# EasyEDA Pro project AED.epro

# Schematic 主控
Board Name: Board1; Create Date: 2025-11-03; Page Name: P1; Project Name: AED; Schematic Name: 主控; Update Date: 2025-11-26; Company: 嘉立创EDA; Page Size: A4; Version: V1.0
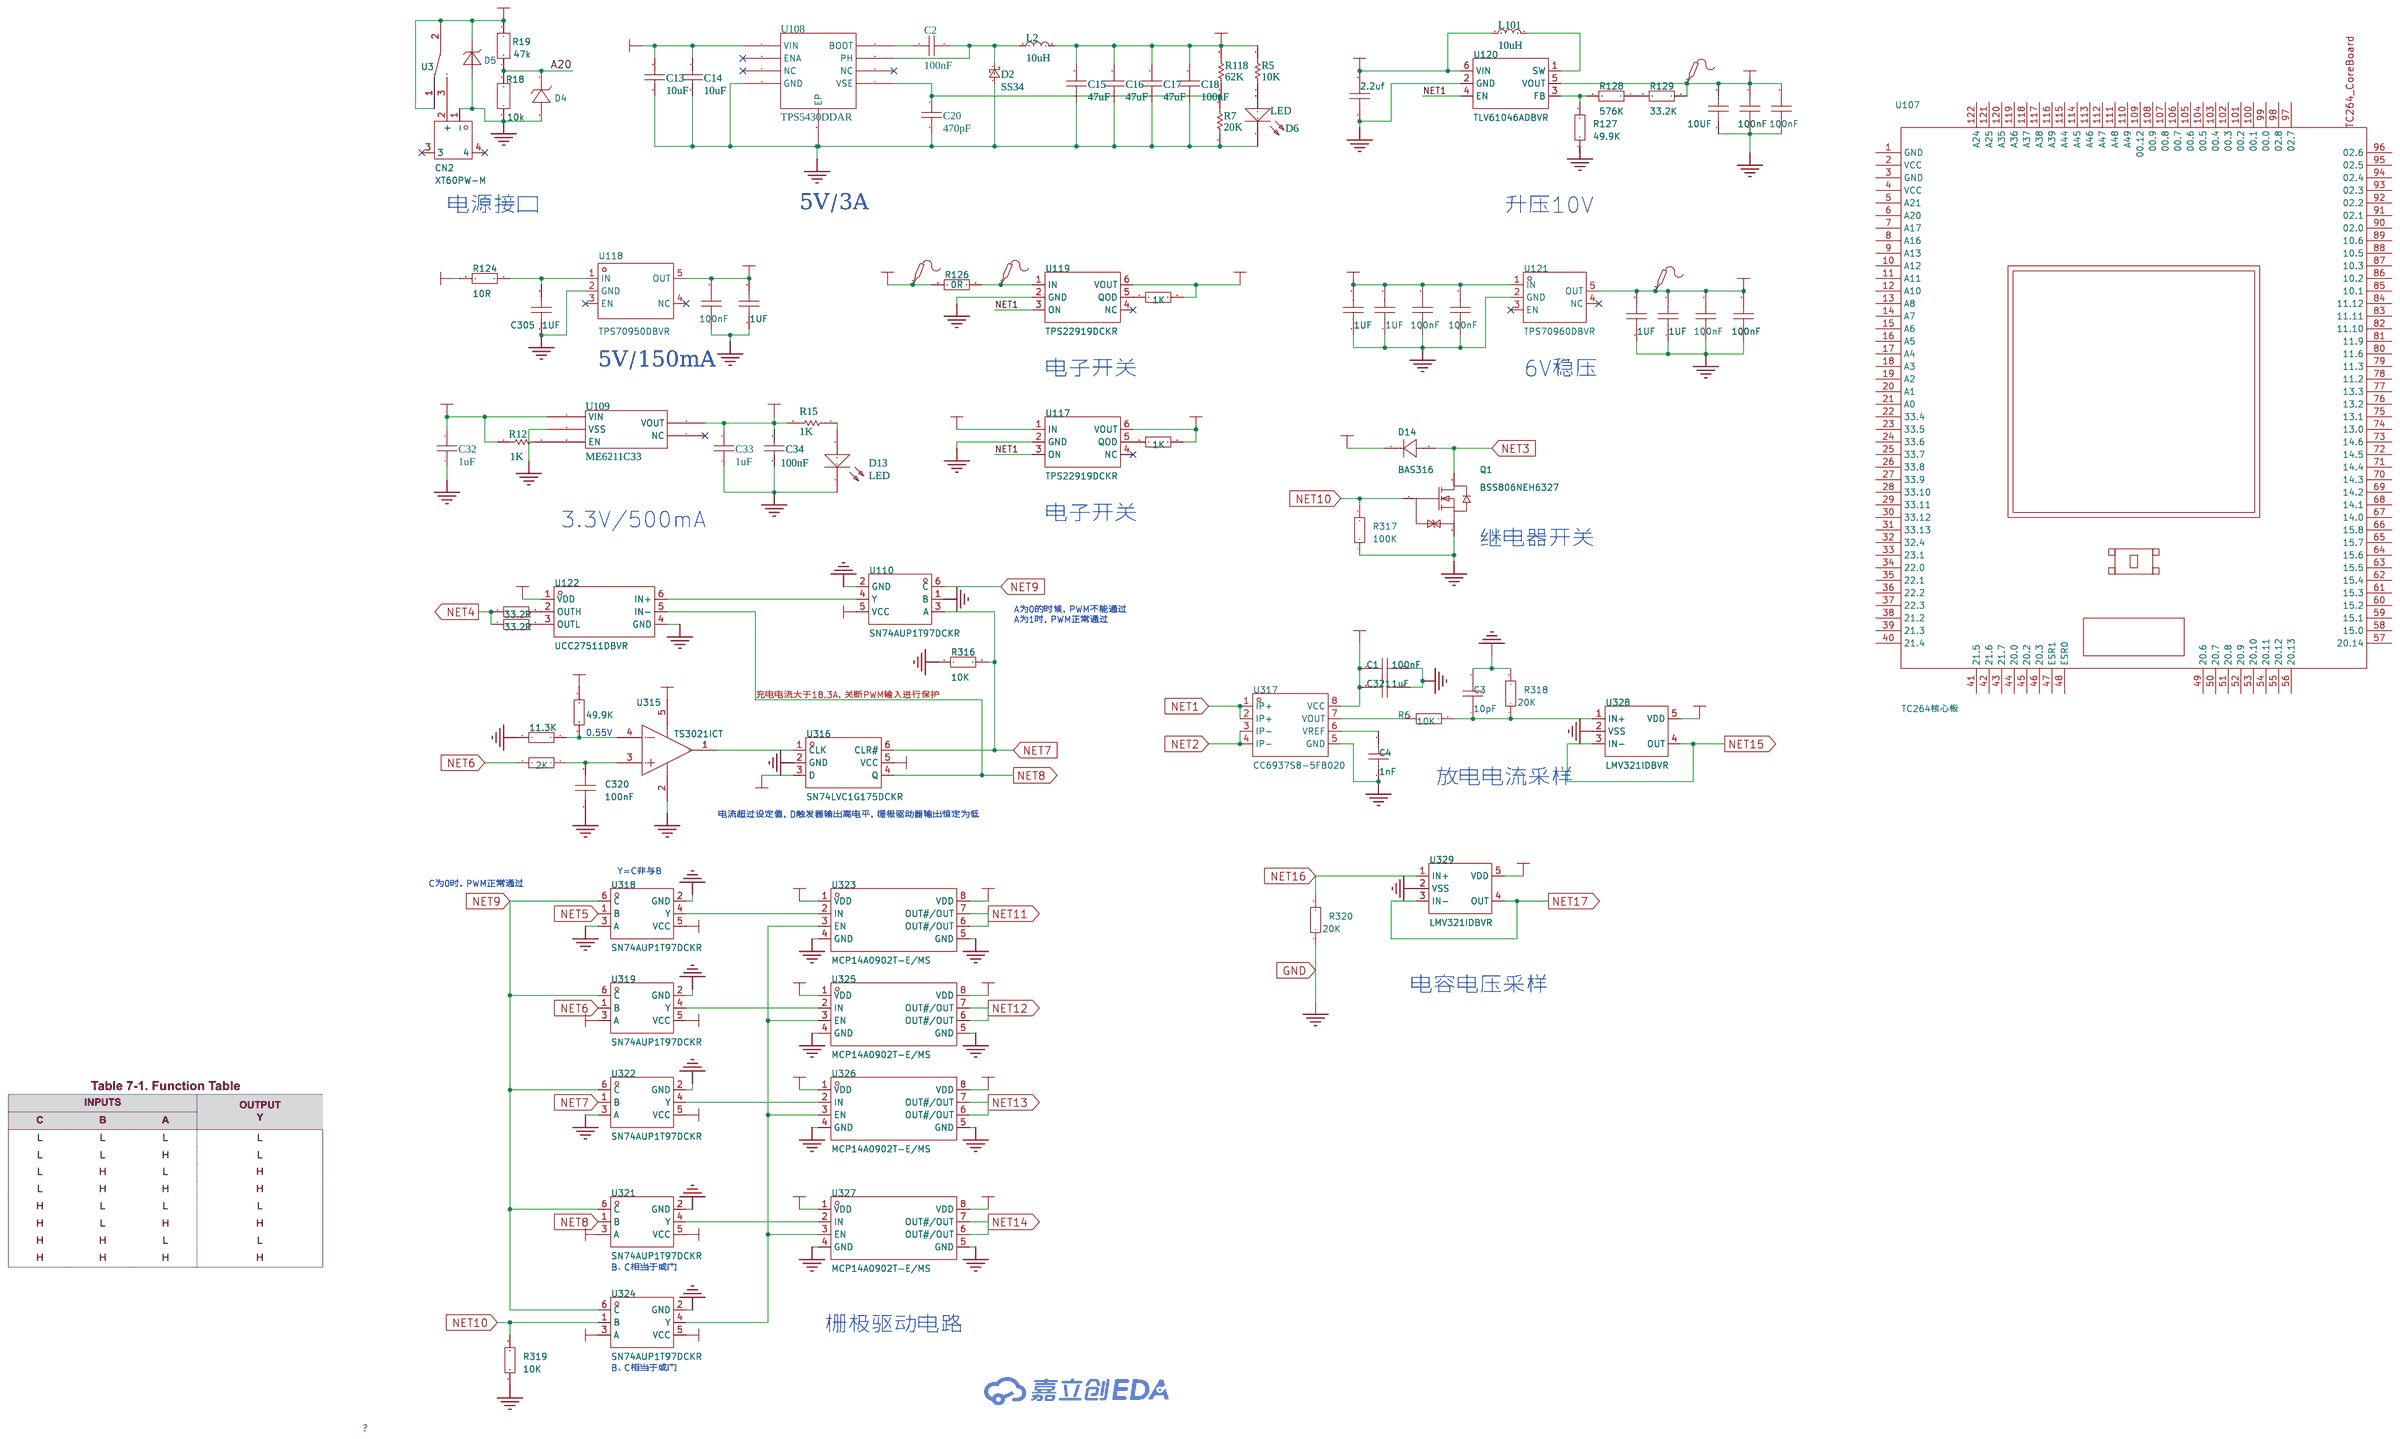
[diagram p0: schematic sheet]

## Parts
C1  100nF  [C0603]
C2  100nF  [0603_C]
C3  10pF  [C0603]
C4  1nF  [C0603]
C13  10uF  [1206_C]
C14  10uF  [1206_C]
C15  47uF  [1206_C]
C16  47uF  [1206_C]
C17  47uF  [1206_C]
C18  100nF  [0603_C]
C20  470pF  [0603_C]
C32  1uF  [0603_C]
C33  1uF  [0603_C]
C34  100nF  [0603_C]
C303  100nF  [C0603]
C305  1UF  [C0603]
C306  1UF  [C0603]
C307  2.2uf  [C0603]
C308  10UF  [C0603]
C309  100nF  [C0603]
C310  100nF  [C0603]
C311  1UF  [C0603]
C312  100nF  [C0603]
C313  1UF  [C0603]
C314  100nF  [C0603]
C315  1UF  [C0603]
C316  100nF  [C0603]
C317  1UF  [C0603]
C318  100nF  [C0603]
C320  100nF  [C0603]
C321  1uF  [C0603]
CN2  XT60PW-M  [CONN-TH_XT60PW-M]
D2  SS34  [SMA, DO-214AC]
D4  BZT52C3V3  [SOD-123_L2.7-W1.6-LS3.7-RD]
D5  SMAJ15A_C908769  [SMA_L4.3-W2.6-LS5.1-RD]
D6  LED  [0603_D]
D13  LED  [0603_D]
D14  BAS316  [SOD-323_L1.7-W1.3-LS2.6-RD-1]
L2  10uH  [SMD-2]
L101  10uH  [SMD-2]
Q1  BSS806NEH6327  [SOT-23_L2.9-W1.3-P1.90-LS2.4-BR]
R5  10K  [0603_R]
R6  10K  [R0603]
R7  20K  [0603_R]
R12  1K  [0603_R]
R15  1K  [0603_R]
R18  10k  [R0603]
R19  47k  [R0603]
R118  62K  [0603_R]
R122  1K  [R0603]
R124  10R  [R0603]
R125  1K  [R0603]
R126  0R  [R0603]
R127  49.9K  [R0603]
R128  576K  [R0603]
R129  33.2K  [R0603]
R310  33.2R  [R0603]
R311  33.2R  [R0603]
R313  49.9K  [R0603]
R314  11.3K  [R0603]
R315  2K  [R0603]
R316  10K  [R0603]
R317  100K  [R0603]
R318  20K  [R0603]
R319  10K  [R0603]
R320  20K  [R0603]
TP126  -  [Test-Point-0.5mm]
TP127  -  [Test-Point-0.5mm]
TP128  -  [Test-Point-0.5mm]
TP129  -  [Test-Point-0.5mm]
U3  MT-0-102-A101-M200-RS+PJ  [SW-TH_MT-0-103-A101-M200-RS]
U107  TC264核心板  [TC264逐飞]
U108  TPS5430DDAR  [SO-8]
U109  ME6211C33  [SOT-23-5]
U110  SN74AUP1T97DCKR  [SC-70-6_L2.0-W1.3-P0.65-LS2.2-BL]
U117  TPS22919DCKR  [SC-70-6_L2.2-W1.3-P0.65-LS2.1-BR]
U118  TPS70950DBVR  [SOT-23-5_L3.0-W1.7-P0.95-LS2.8-BR]
U119  TPS22919DCKR  [SC-70-6_L2.2-W1.3-P0.65-LS2.1-BR]
U120  TLV61046ADBVR  [SOT-23-6_L2.9-W1.6-P0.95-LS2.8-BL]
U121  TPS70960DBVR  [SOT-23-5_L2.9-W1.6-P0.95-LS2.8-BR]
U122  UCC27511DBVR  [SOT-23-6_L2.9-W1.6-P0.95-LS2.8-BL]
U315  TS3021ICT  [SC-70-5_L2.1-W1.3-P0.65-LS2.1-BL]
U316  SN74LVC1G175DCKR  [SC-70-6_L2.0-W1.3-P0.65-LS2.1-BR]
U317  CC6937S8-5FB020  [SOP-8_L4.9-W3.9-P1.27-LS6.0-BL]
U318  SN74AUP1T97DCKR  [SC-70-6_L2.0-W1.3-P0.65-LS2.2-BL]
U319  SN74AUP1T97DCKR  [SC-70-6_L2.0-W1.3-P0.65-LS2.2-BL]
U321  SN74AUP1T97DCKR  [SC-70-6_L2.0-W1.3-P0.65-LS2.2-BL]
U322  SN74AUP1T97DCKR  [SC-70-6_L2.0-W1.3-P0.65-LS2.2-BL]
U323  MCP14A0902T-E/MS  [MSOP-8_L3.0-W3.0-P0.65-LS4.9-BL]
U324  SN74AUP1T97DCKR  [SC-70-6_L2.0-W1.3-P0.65-LS2.2-BL]
U325  MCP14A0902T-E/MS  [MSOP-8_L3.0-W3.0-P0.65-LS4.9-BL]
U326  MCP14A0902T-E/MS  [MSOP-8_L3.0-W3.0-P0.65-LS4.9-BL]
U327  MCP14A0902T-E/MS  [MSOP-8_L3.0-W3.0-P0.65-LS4.9-BL]
U328  LMV321IDBVR  [SOT-23-5_L2.9-W1.6-P0.95-LS2.8-BR]
U329  LMV321IDBVR  [SOT-23-5_L2.9-W1.6-P0.95-LS2.8-BR]

## Library data of the parts
C1 C3 C4 C303 C305-C318 C320 C321 = CAP_0603: Supplier Footprint: 0603
C2 C18 = 100nF: 电容; Published: 8-Jun-2000; LatestRevisionDate: 29-May-2009; LatestRevisionNote: IPC-7351 Footprint Added.; PackageReference: C1206; Publisher: Altium Limited; PackageDescription: Chip Capacitor; Origin Footprint 2: 0805_C; Origin Footprint 3: 1206_C; Design Item ID: C; Library Name: MyLib; Check: false
C13 C14 = 10uF: 电容; Published: 8-Jun-2000; LatestRevisionDate: 29-May-2009; LatestRevisionNote: IPC-7351 Footprint Added.; PackageReference: C1206; Publisher: Altium Limited; PackageDescription: Chip Capacitor; Origin Footprint 2: 0603_C; Origin Footprint 3: 0805_C; Design Item ID: C; Library Name: MyLib; Check: false
C15-C17 = 47uF: 电容; Published: 8-Jun-2000; LatestRevisionDate: 29-May-2009; LatestRevisionNote: IPC-7351 Footprint Added.; PackageReference: C1206; Publisher: Altium Limited; PackageDescription: Chip Capacitor; Origin Footprint 2: 0603_C; Origin Footprint 3: 0805_C; Design Item ID: C; Library Name: MyLib; Check: false
C20 = 470pF: 电容; Published: 8-Jun-2000; LatestRevisionDate: 29-May-2009; LatestRevisionNote: IPC-7351 Footprint Added.; PackageReference: C1206; Publisher: Altium Limited; PackageDescription: Chip Capacitor; Origin Footprint 2: 0805_C; Origin Footprint 3: 1206_C; Design Item ID: C; Library Name: MyLib; Check: false
C32 C33 = 1uF: 电容; Published: 8-Jun-2000; LatestRevisionDate: 29-May-2009; LatestRevisionNote: IPC-7351 Footprint Added.; PackageReference: C1206; Publisher: Altium Limited; PackageDescription: Chip Capacitor; Origin Footprint 2: 0805_C; Origin Footprint 3: 1206_C; Design Item ID: C; Library Name: MyLib
C34 = 100nF: 电容; Published: 8-Jun-2000; LatestRevisionDate: 29-May-2009; LatestRevisionNote: IPC-7351 Footprint Added.; PackageReference: C1206; Publisher: Altium Limited; PackageDescription: Chip Capacitor; Origin Footprint 2: 0805_C; Origin Footprint 3: 1206_C; Design Item ID: C; Library Name: MyLib
CN2 = XT60PW-M: 类别:-;类型1:-;; LCSC Part Name: AMASS(艾迈斯)航模插头xt60连接器150公母对接pw锂电池公头 板插卧式XT60PW-M; Supplier Part: C98732; Manufacturer: AMASS(艾迈斯); JLCPCB Part Class: 扩展库; Datasheet: https://item.szlcsc.com/datasheet/XT60PW-M/99942.html; Supplier: LCSC; Type: 卧式插头; Colour: 黄色; InterfaceType: 公头
D2 = SS34: 二极管; Library Name: MyLib; Check: false
D4 = BZT52C3V3: Supplier: LCSC; Supplier Part: C908185; Manufacturer: FUXINSEMI(富芯森美); JLCPCB Part Class: Extended Part
D5 = SMAJ15A_C908769: Supplier: LCSC; Supplier Part: C908769; Manufacturer: GOODWORK(固得沃克); Manufacturer Part: SMAJ15A; JLCPCB Part Class: Extended Part
D6 = LED: 发光二极管; Published: 8-Jun-2000; LatestRevisionDate: 08-Jul-2005; LatestRevisionNote: Mech Layer 1 removed.; PackageReference: LED-0; Publisher: Altium Limited; PackageDescription: LED; 2 Leads; Library Name: MyLib; Check: false
D13 = LED: 发光二极管; Published: 8-Jun-2000; LatestRevisionDate: 08-Jul-2005; LatestRevisionNote: Mech Layer 1 removed.; PackageReference: LED-0; Publisher: Altium Limited; PackageDescription: LED; 2 Leads; Library Name: MyLib
D14 = BAS316_C7502720: 二极管配置:独立式;正向压降(Vf):1.25V@150mA;直流反向耐压(Vr):100V;整流电流:250mA;反向恢复时间(Trr):4ns;; Supplier Part: C7502720; Manufacturer: R+O(宏嘉诚); Supplier Footprint: SOD-323; JLCPCB Part Class: 扩展库; Datasheet: https://item.szlcsc.com/datasheet/BAS316/8589437.html; Supplier: LCSC; Diode Configuration: 独立式; Voltage - Forward(Vf@If): 1.25V@150mA; Voltage - DC Reverse(Vr): 100V; Current - Rectified: 250mA; Pd - Power Dissipation: 250mW; Reverse Leakage Current (Ir): 1uA; Reverse Recovery Time (trr): 4ns; Operating Junction Temperature Range: -55℃~+150℃; Non-Repetitive Peak Forward Surge Current: 2A
L2 L101 = 10uH: 电感; Origin Footprint 2: 0603_L; Design Item ID: L; Library Name: MyLib; Check: false
Q1 = BSS806NEH6327: 数量:1个N沟道;漏源电压(Vdss):20V;连续漏极电流(Id):2.3A;导通电阻(RDS(on)):57mΩ@2.5V,2.3A;耗散功率(Pd):500mW;阈值电压(Vgs(th)):750mV;; LCSC Part Name: 1个N沟道 耐压:20V 电流:2.3A; Supplier Part: C91714; Manufacturer: Infineon(英飞凌); Supplier Footprint: SOT-23; JLCPCB Part Class: 扩展库; Datasheet: https://item.szlcsc.com/datasheet/BSS806NEH6327/92903.html; Supplier: LCSC; Number: 1个N沟道; Drain to Source Voltage: 20V; Current - Continuous Drain(Id): 2.3A; RDS(on): 57mΩ@2.5V,2.3A; Pd - Power Dissipation: 500mW; Gate Threshold Voltage (Vgs(th)): 750mV; Gate Charge(Qg): 1.7nC@2.5V; Input Capacitance(Ciss): 529pF@10V; Reverse Transfer Capacitance (Crss@Vds): 29pF@10V; Operating Temperature: -55℃~+150℃
R5 R7 = 10K: 电阻; Published: 8-Jun-2000; LatestRevisionDate: 17-Jul-2002; LatestRevisionNote: Re-released for DXP Platform.; PackageReference: AXIAL-0.5; Publisher: Altium Limited; PackageDescription: Axial Device, Thru-Hole; 2 Leads; 0.5 in Pin Spacing; Design Item ID: R; Library Name: MyLib; Check: false
R6 R122 R124-R129 R310 R311 R313-R320 = Res_0603: Supplier Footprint: 0603
R12 = 1K: 电阻; Published: 8-Jun-2000; LatestRevisionDate: 17-Jul-2002; LatestRevisionNote: Re-released for DXP Platform.; PackageReference: AXIAL-0.5; Publisher: Altium Limited; PackageDescription: Axial Device, Thru-Hole; 2 Leads; 0.5 in Pin Spacing; Design Item ID: R; Library Name: MyLib
R15 = 10K: 电阻; Published: 8-Jun-2000; LatestRevisionDate: 17-Jul-2002; LatestRevisionNote: Re-released for DXP Platform.; PackageReference: AXIAL-0.5; Publisher: Altium Limited; PackageDescription: Axial Device, Thru-Hole; 2 Leads; 0.5 in Pin Spacing; Design Item ID: R; Library Name: MyLib
R18 = 10k
R19 = 47k
R118 = 51K: 电阻; Published: 8-Jun-2000; LatestRevisionDate: 17-Jul-2002; LatestRevisionNote: Re-released for DXP Platform.; PackageReference: AXIAL-0.5; Publisher: Altium Limited; PackageDescription: Axial Device, Thru-Hole; 2 Leads; 0.5 in Pin Spacing; Design Item ID: R; Library Name: MyLib; Check: false
TP126-TP129 = Test-Point: Test Point 测试点
U3 = MT-0-102-A101-M200-RS+PJ: Supplier: LCSC; Supplier Part: C1788492; Manufacturer: YUEN FUNG(源丰); JLCPCB Part Class: Extended Part; link: https://atta.szlcsc.com/upload/public/pdf/source/20201225/C1788492_A57BE75F5111615E295075D92E39ECB7.pdf
U107 = TC264核心板: Supplier: 逐飞
U108 = TPS5430DDAR: 降压芯片; Library Name: MyLib; Check: false
U109 = ME6211C33: 稳压芯片; Library Name: MyLib
U110 U318 U319 U321 U322 U324 = SN74AUP1T97DCKR: 数据速率:-;工作电压(VCCA):1.8V~2.7V;工作电压(VCCB):2.3V~3.6V;通道数:1;每个电路通道数:1;; LCSC Part Name: 1位单向电平转换器; Supplier Part: C2677402; Manufacturer: TI(德州仪器); Supplier Footprint: SC-70-6; JLCPCB Part Class: 扩展库; Datasheet: https://www.ti.com/cn/lit/gpn/sn74aup1t97; Supplier: LCSC; Channel Type: 单向; Voltage - Supply(VCCA): 1.8V~2.7V; Voltage - Supply(VCCB): 2.3V~3.6V; Number of Circuits: 1; Output Type: 单端; Operating Temperature: -40℃~+85℃; Features: 可配置门逻辑功能
U117 U119 = TPS22919DCKR: 类型:负载开关;通道数:1;输入控制逻辑:高电平有效;最大连续电流:1.5A;工作电压:1.6V~5.5V;导通电阻:89mΩ;; LCSC Part Name: 5.5V 1.5A 90mΩ 受控上升时间自保护负载开关; Supplier Part: C2149796; Manufacturer: TI(德州仪器); Supplier Footprint: SC-70-6; JLCPCB Part Class: 扩展库; Datasheet: https://www.ti.com/cn/lit/gpn/tps22919; Supplier: LCSC; Type: 负载开关; Number of Channels: 1; Control Input Logic: 高电平有效; Maximum Continuous Current: 1.5A; Voltage - Supply: 1.6V~5.5V; RDS(on): 89mΩ; Operating Temperature	-: -40℃~+125℃; Features: 过热保护(OTP)；短路保护(SCP)
U118 = TPS70950DBVR: 输出类型:固定;最大输入电压:30V;输出电压:5V;输出电流:150mA;电源纹波抑制比(PSRR):80dB;输出极性:正极;; LCSC Part Name: 具有反向电流保护和使能功能的 150mA、30V、超低 IQ、低压降稳压器; Supplier Part: C96028; Manufacturer: TI(德州仪器); Supplier Footprint: SOT-23-5; JLCPCB Part Class: 扩展库; Datasheet: https://www.ti.com/cn/lit/gpn/tps709; Supplier: LCSC; Output Type: 固定; Maximum Input Voltage: 30V; Output Voltage: 5V; Output Current: 150mA; Power Supply Rejection Ratio (PSRR): 80dB; Dropout Voltage: 1.2V@(150mA); standby current: 2.05uA; Feature: 防静电保护；低ESR；热保护(TSD)；欠压闭锁；过流保护(OCP)；带使能；防倒灌; Operating Temperature: -40℃~+125℃; Output Polarity: 正极; Number of Outputs: 1
U120 = TLV61046ADBVR: 功能类型:升压型;输出类型:可调;输入电压:1.8V~5.5V;输出电压:3.3V~28V;输出电流(最大值):-;; Supplier Part: C464815; Manufacturer: TI(德州仪器); Supplier Footprint: SOT-23-6; JLCPCB Part Class: 扩展库; Datasheet: https://www.ti.com/cn/lit/gpn/tlv61046a; Supplier: LCSC; Function: 升压型; Output Type: 可调; Input Voltage: 1.8V~5.5V; Output Voltage: 3.3V~28V; Switching Frequency: 1.05MHz; Operating Temperature: -40℃~+125℃@(TJ); Number of Outputs: 1; Topology: 升压式; Switch tube (built-in/external): 内置
U121 = TPS70960DBVR: 输出类型:固定;最大输入电压:30V;输出电压:6V;输出电流:150mA;输出极性:正极;; LCSC Part Name: 具有反向电流保护和使能功能的 150mA、30V、超低 IQ、低压降稳压器; Supplier Part: C2760467; Manufacturer: TI(德州仪器); Supplier Footprint: SOT-23-5; JLCPCB Part Class: 扩展库; Datasheet: https://www.ti.com/cn/lit/gpn/tps709; Supplier: LCSC; Output Type: 固定; Maximum Input Voltage: 30V; Output Voltage: 6V; Output Current: 150mA; Dropout Voltage: 1.2V@(150mA); standby current: 2.05uA; Feature: 防静电保护；热保护(TSD)；欠压闭锁；过流保护(OCP)；带使能；防倒灌; Operating Temperature: -40℃~+125℃; Output Polarity: 正极; Number of Outputs: 1
U122 = UCC27511DBVR: 驱动配置:低边;负载类型:IGBT；MOSFET;驱动通道数:1;灌电流(IOL):8A;拉电流(IOH):4A;工作电压:4.5V~18V;上升时间(tr):8ns;下降时间(tf):7ns;; LCSC Part Name: 单通道、高速、低端栅极驱动器; Supplier Part: C191027; Manufacturer: TI(德州仪器); Supplier Footprint: SOT-23-6; JLCPCB Part Class: 扩展库; Datasheet: https://www.ti.com/cn/lit/gpn/ucc27511; Supplier: LCSC; Driven Configuration: 低边; Load Type: IGBT；MOSFET; Number of Drivers: 1; Current - Output Low(IOL): 8A; Current - Output High(IOH): 4A; Voltage - Supply: 4.5V~18V; Rise Time: 8ns; Fall Time: 7ns; Propagation Delay tpLH: 13ns; Propagation Delay tpHL: 13ns; Features: 欠压保护(UVP); Operating Temperature: -40℃~+140℃; Input Logic Level - High: 2.2V~2.4V; Input Logic Level - Low: 1V~1.2V; Quiescent Current(Iq): 100uA
U315 = TS3021ICT: 输入失调电压(Vos):6mV;输入偏置电流(Ib):160nA;; Supplier Part: C443981; Manufacturer: ST(意法半导体); Supplier Footprint: SC-70; JLCPCB Part Class: 扩展库; Datasheet: https://atta.szlcsc.com/upload/public/pdf/source/20191104/C443981_776DA475306693A7E4F23C19D704A3F3.pdf; Supplier: LCSC; Input Offset Voltage (Vos): 6mV; Input Bias Current (Ib): 160nA; Common Mode Rejection Ratio (CMRR): 79dB; Supply Voltage: 1.8V~5V; Output Type: 推挽; Operating Temperature: -40℃~+125℃
U316 = SN74LVC1G175DCKR: 类型:D-型;工作电压:1.65V~5.5V;时钟频率(fc):175MHz;元件数:1;每个元件位数:1;传播延迟(tpd):5ns@5V,50pF;静态电流(Iq):10uA;; LCSC Part Name: 单路D型触发器与异步清除; Supplier Part: C202238; Manufacturer: TI(德州仪器); Supplier Footprint: SOT-363-6; JLCPCB Part Class: 扩展库; Datasheet: https://www.ti.com/cn/lit/gpn/sn74lvc1g175; Supplier: LCSC; Type: D-型; Trigger Type: 上升沿; Voltage - Supply: 1.65V~5.5V; Clock Frequency: 175MHz; Function: 复位; Number of Elements: 1; Number of Bits per Element: 1; Propagation Delay: 5ns@5V,50pF; Series: 74LVC系列; Current - Output Low(IOL): 32mA; Current - Output High(IOH): 32mA; Quiescent Current: 10uA; Input Capacitance: 3pF; Operating Temperature: -40℃~+125℃
U317 = CC6937S8-5FB020: Supplier Part: C41421925; Manufacturer: CrossChip(成都芯进); Supplier Footprint: SOP-8; JLCPCB Part Class: 扩展库; Datasheet: https://atta.szlcsc.com/upload/public/pdf/source/20241008/FBE923A19560CB1EFA280EA7B85C6E96.pdf; Supplier: LCSC
U323 U325-U327 = MCP14A0902T-E/MS: 驱动配置:低边；高边;负载类型:MOSFET;驱动通道数:2;峰值灌电流:9A;峰值拉电流:9A;电源电压:4.5V~18V;上升时间:22ns;下降时间:22ns;; Supplier Part: C627011; Manufacturer: MICROCHIP(美国微芯); Supplier Footprint: MSOP-8; JLCPCB Part Class: 扩展库; Datasheet: https://atta.szlcsc.com/upload/public/pdf/source/20221017/A342458C727318430080595DBBFFEC04.pdf; Supplier: LCSC; Driven Configuration: 低边；高边; Load Type: MOSFET; Number of Drivers: 2; Peak Output Current(sink): 9A; Peak Output Current(source): 9A; Supply Voltage: 4.5V~18V; Rise Time: 22ns; Fall Time: 22ns; Operating Temperature: -40℃~+125℃@(Ta)
U328 U329 = LMV321IDBVR_C3014306: 放大器数:单路;轨到轨:轨到轨输入,轨到轨输出;增益带宽积(GBP):1MHz;输入失调电压(Vos):5mV;压摆率(SR):520V/ms;输入偏置电流(Ib):10pA;; LCSC Part Name: 低功耗，轨到轨运算放大器; Supplier Part: C3014306; Manufacturer: UMW(友台半导体); Supplier Footprint: SOT-23-5; JLCPCB Part Class: 扩展库; Datasheet: https://item.szlcsc.com/datasheet/LMV321IDBVR/3524159.html; Supplier: LCSC; Number of Channels: 单路; Maximum Power Supply Range (Vdd-Vss): 7.5V; Rail to Rail: 轨到轨输入,轨到轨输出; Gain Bandwidth Product: 1MHz; Vos - Input Offset Voltage: 5mV; Input Offset Voltage Drift(Vos TC): 2.7uV/℃; Slew Rate: 520V/ms; Ib - Input Bias Current: 10pA; Input Offset Current(Ios): 10pA; Noise density(eN): 20nV/√Hz@10KHz; Common Mode Rejection Ratio(CMRR): 70dB; Quiescent Current: 45uA; Output Current: 25mA; Operating Temperature: -40℃~+125℃; Single supply: 2.1V~5.5V

## Nets
GND: C1.2 C3.2 C4.1 C13.1 C14.1 C15.1 C16.1 C17.1 C18.1 C20.1 C32.1 C33.1 C34.1 C303.1 C305.1 C306.1 C307.1 C308.1 C309.1 C310.1 C311.1 C312.1 C313.1 C314.1 C315.1 C316.1 C317.1 C318.1 C320.1 C321.2 CN2.1(-) D2.2(14) D4.2(A) D5.2 D6.1 D13.1 Q1.2(S) R7.1 R18.1 R127.1 R314.2 R316.1 R317.1 R318.2 R319.1 R320.1 U108.6(GND) U108.9(EP) U109.2(VSS) U110.1(B) U110.2(GND) U117.2(GND) U118.2(GND) U119.2(GND) U120.2(GND) U121.2(GND) U122.4(GND) U315.2(VCC-) U316.2(GND) U317.5(GND) U318.2(GND) U318.3(A) U319.2(GND) U321.2(GND) U322.2(GND) U322.3(A) U323.4(GND) U323.5(GND) U324.2(GND) U325.4(GND) U325.5(GND) U326.4(GND) U326.5(GND) U327.4(GND) U327.5(GND) U328.2(VSS) U329.2(VSS)
VBAT: C13.2 C14.2 D5.1 R19.2 R124.1 U3.1 U3.2 U108.7(VIN)
VCC_3V3: C33.2 C34.2 R15.2 U109.5(VOUT) U117.1(IN)
VCC_3V3_1: R122.2 R313.2 U110.5(VCC) U117.6(VOUT) U315.5(VCC+) U316.3(D) U316.5(VCC) U318.5(VCC) U319.3(A) U319.5(VCC) U321.3(A) U321.5(VCC) U322.5(VCC) U324.3(A) U324.5(VCC) U328.5(VDD) U329.5(VDD)
VCC_5V: C15.2 C16.2 C17.2 C18.2 C32.2 C307.2 L2.2(NC) L101.1(NC) R5.2 R12.2 R118.2 U109.1(VIN) U120.6(VIN)
VCC_5V_1: C303.2 C306.2 R126.1 TP126.1 U118.5(OUT)
VCC_5V_2: C1.1 C321.1 D14.1(K) R125.2 U119.6(VOUT) U317.8(VCC)
VCC_6V: C315.2 C316.2 C317.2 C318.2 TP128.1 U121.5(OUT) U122.1(VDD)
VCC_10V: C308.2 C309.2 C310.2 C311.2 C312.2 C313.2 C314.2 R129.1 TP129.1 U120.5(VOUT) U121.1(IN) U323.1(VDD) U323.8(VDD) U325.1(VDD) U325.8(VDD) U326.1(VDD) U326.8(VDD) U327.1(VDD) U327.8(VDD)
A20: D4.1(K) R18.2 R19.1
NET1: U117.3(ON) U119.3(ON) U120.4(EN) U317.1(IP+) U317.2(IP+)
NET2: U317.3(IP-) U317.4(IP-)
NET3: D14.2(A) Q1.3(D)
NET4: R310.1 R311.1
NET5: U318.1(B)
NET6: R315.2 U319.1(B)
NET7: R316.2 U110.3(A) U316.6(CLR#) U322.1(B)
NET8: U122.5(IN-) U316.4(Q) U321.1(B)
NET9: U110.6(C) U318.6(C) U319.6(C) U321.6(C) U322.6(C) U324.6(C)
NET10: Q1.1(G) R317.2 R319.2 U324.1(B)
NET11: U323.6(OUT#/OUT) U323.7(OUT#/OUT)
NET12: U325.6(OUT#/OUT) U325.7(OUT#/OUT)
NET13: U326.6(OUT#/OUT) U326.7(OUT#/OUT)
NET14: U327.6(OUT#/OUT) U327.7(OUT#/OUT)
NET15: U328.3(IN-) U328.4(OUT)
NET16: R320.2 U329.1(IN+)
NET17: U329.3(IN-) U329.4(OUT)
Net-(C2-1): C2.1 D2.1(13) L2.1(NC) U108.8(PH)
Net-(C2-2): C2.2 U108.1(BOOT)
Net-(C3-1): C3.1 R6.2 R318.1 U328.1(IN+)
Net-(C4-2): C4.2 U317.6(VREF)
Net-(C20-2): C20.2 R7.2 R118.1 U108.4(VSE)
Net-(C305-2): C305.2 R124.2 U118.1(IN)
Net-(C320-2): C320.2 R315.1 U315.3(IN+)
Net-(CN2-2): CN2.2(+) U3.3
Net-(D6-2): D6.2 R5.1
Net-(D13-2): D13.2 R15.1
Net-(L101-2): L101.2(NC) U120.1(SW)
Net-(R6-1): R6.1 U317.7(VOUT)
Net-(R12-1): R12.1 U109.3(EN)
Net-(R122-1): R122.1 U117.5(QOD)
Net-(R125-1): R125.1 U119.5(QOD)
Net-(R126-2): R126.2 TP127.1 U119.1(IN)
Net-(R127-2): R127.2 R128.2 U120.3(FB)
Net-(R128-1): R128.1 R129.2
Net-(R310-2): R310.2 U122.2(OUTH)
Net-(R311-2): R311.2 U122.3(OUTL)
Net-(R313-1): R313.1 R314.1 U315.4(IN-)
Net-(U110-4): U110.4(Y) U122.6(IN+)
Net-(U315-1): U315.1(OUT) U316.1(CLK)
Net-(U318-4): U318.4(Y) U323.2(IN)
Net-(U319-4): U319.4(Y) U325.2(IN)
Net-(U321-4): U321.4(Y) U327.2(IN)
Net-(U322-4): U322.4(Y) U326.2(IN)
Net-(U323-3): U323.3(EN) U324.4(Y) U325.3(EN) U326.3(EN) U327.3(EN)

Not connected (* = marked no-connect by the designer): CN2 3* 4*; U107 1(GND) 2(VCC) 3(GND) 4(VCC) 5(A21) 6(A20) 7(A17) 8(A16) 9(A13) 10(A12) 11(A11) 12(A10) 13(A8) 14(A7) 15(A6) 16(A5) 17(A4) 18(A3) 19(A2) 20(A1) 21(A0) 22(33.4) 23(33.5) 24(33.6) 25(33.7) 26(33.8) 27(33.9) 28(33.10) 29(33.11) 30(33.12) 31(33.13) 32(32.4) 33(23.1) 34(22.0) 35(22.1) 36(22.2) 37(22.3) 38(21.2) 39(21.3) 40(21.4) 41(21.5) 42(21.6) 43(21.7) 44(20.0) 45(20.2) 46(20.3) 47(ESR1) 48(ESR0) 49(20.6) 50(20.7) 51(20.8) 52(20.9) 53(20.10) 54(20.11) 55(20.12) 56(20.13) 57(20.14) 58(15.0) 59(15.1) 60(15.2) 61(15.3) 62(15.4) 63(15.5) 64(15.6) 65(15.7) 66(15.8) 67(14.0) 68(14.1) 69(14.2) 70(14.3) 71(14.4) 72(14.5) 73(14.6) 74(13.0) 75(13.1) 76(13.2) 77(13.3) 78(11.2) 79(11.3) 80(11.6) 81(11.9) 82(11.10) 83(11.11) 84(11.12) 85(10.1) 86(10.2) 87(10.3) 88(10.5) 89(10.6) 90(02.0) 91(02.1) 92(02.2) 93(02.3) 94(02.4) 95(02.5) 96(02.6) 97(02.7) 98(02.8) 99(00.0) 100(00.1) 101(00.2) 102(00.3) 103(00.4) 104(00.5) 105(00.6) 106(00.7) 107(00.8) 108(00.9) 109(00.12) 110(A49) 111(A48) 112(A47) 113(A46) 114(A45) 115(A44) 116(A39) 117(A38) 118(A37) 119(A36) 120(A35) 121(A25) 122(A24); U108 2(NC)* 3(NC)* 5(ENA)*; U109 4(NC)*; U117 4(NC)*; U118 3(EN)* 4(NC)*; U119 4(NC)*; U121 3(EN)* 4(NC)*

## Notes on the sheet
- 电源接口
- 5V/3A
- 升压10V
- 5V/150mA
- 电子开关
- 6V稳压
- 3.3V/500mA
- 电子开关
- 继电器开关
- A为0的时候，PWM不能通过
  A为1时，PWM正常通过
- 充电电流大于18.3A，关断PWM输入进行保护
- 0.55V
- 放电电流采样
- 电流超过设定值，D触发器输出高电平，栅极驱动器输出恒定为低
- Y=C非与B
- C为0时，PWM正常通过
- 电容电压采样
- B、C相当于或门
- 栅极驱动电路
- B、C相当于或门

# Schematic 充放电
Board Name: Board2; Create Date: 2025-11-03; Page Name: P1; Project Name: AED; Schematic Name: 充放电; Update Date: 2025-11-10; Company: 嘉立创EDA; Page Size: A4; Version: V1.0
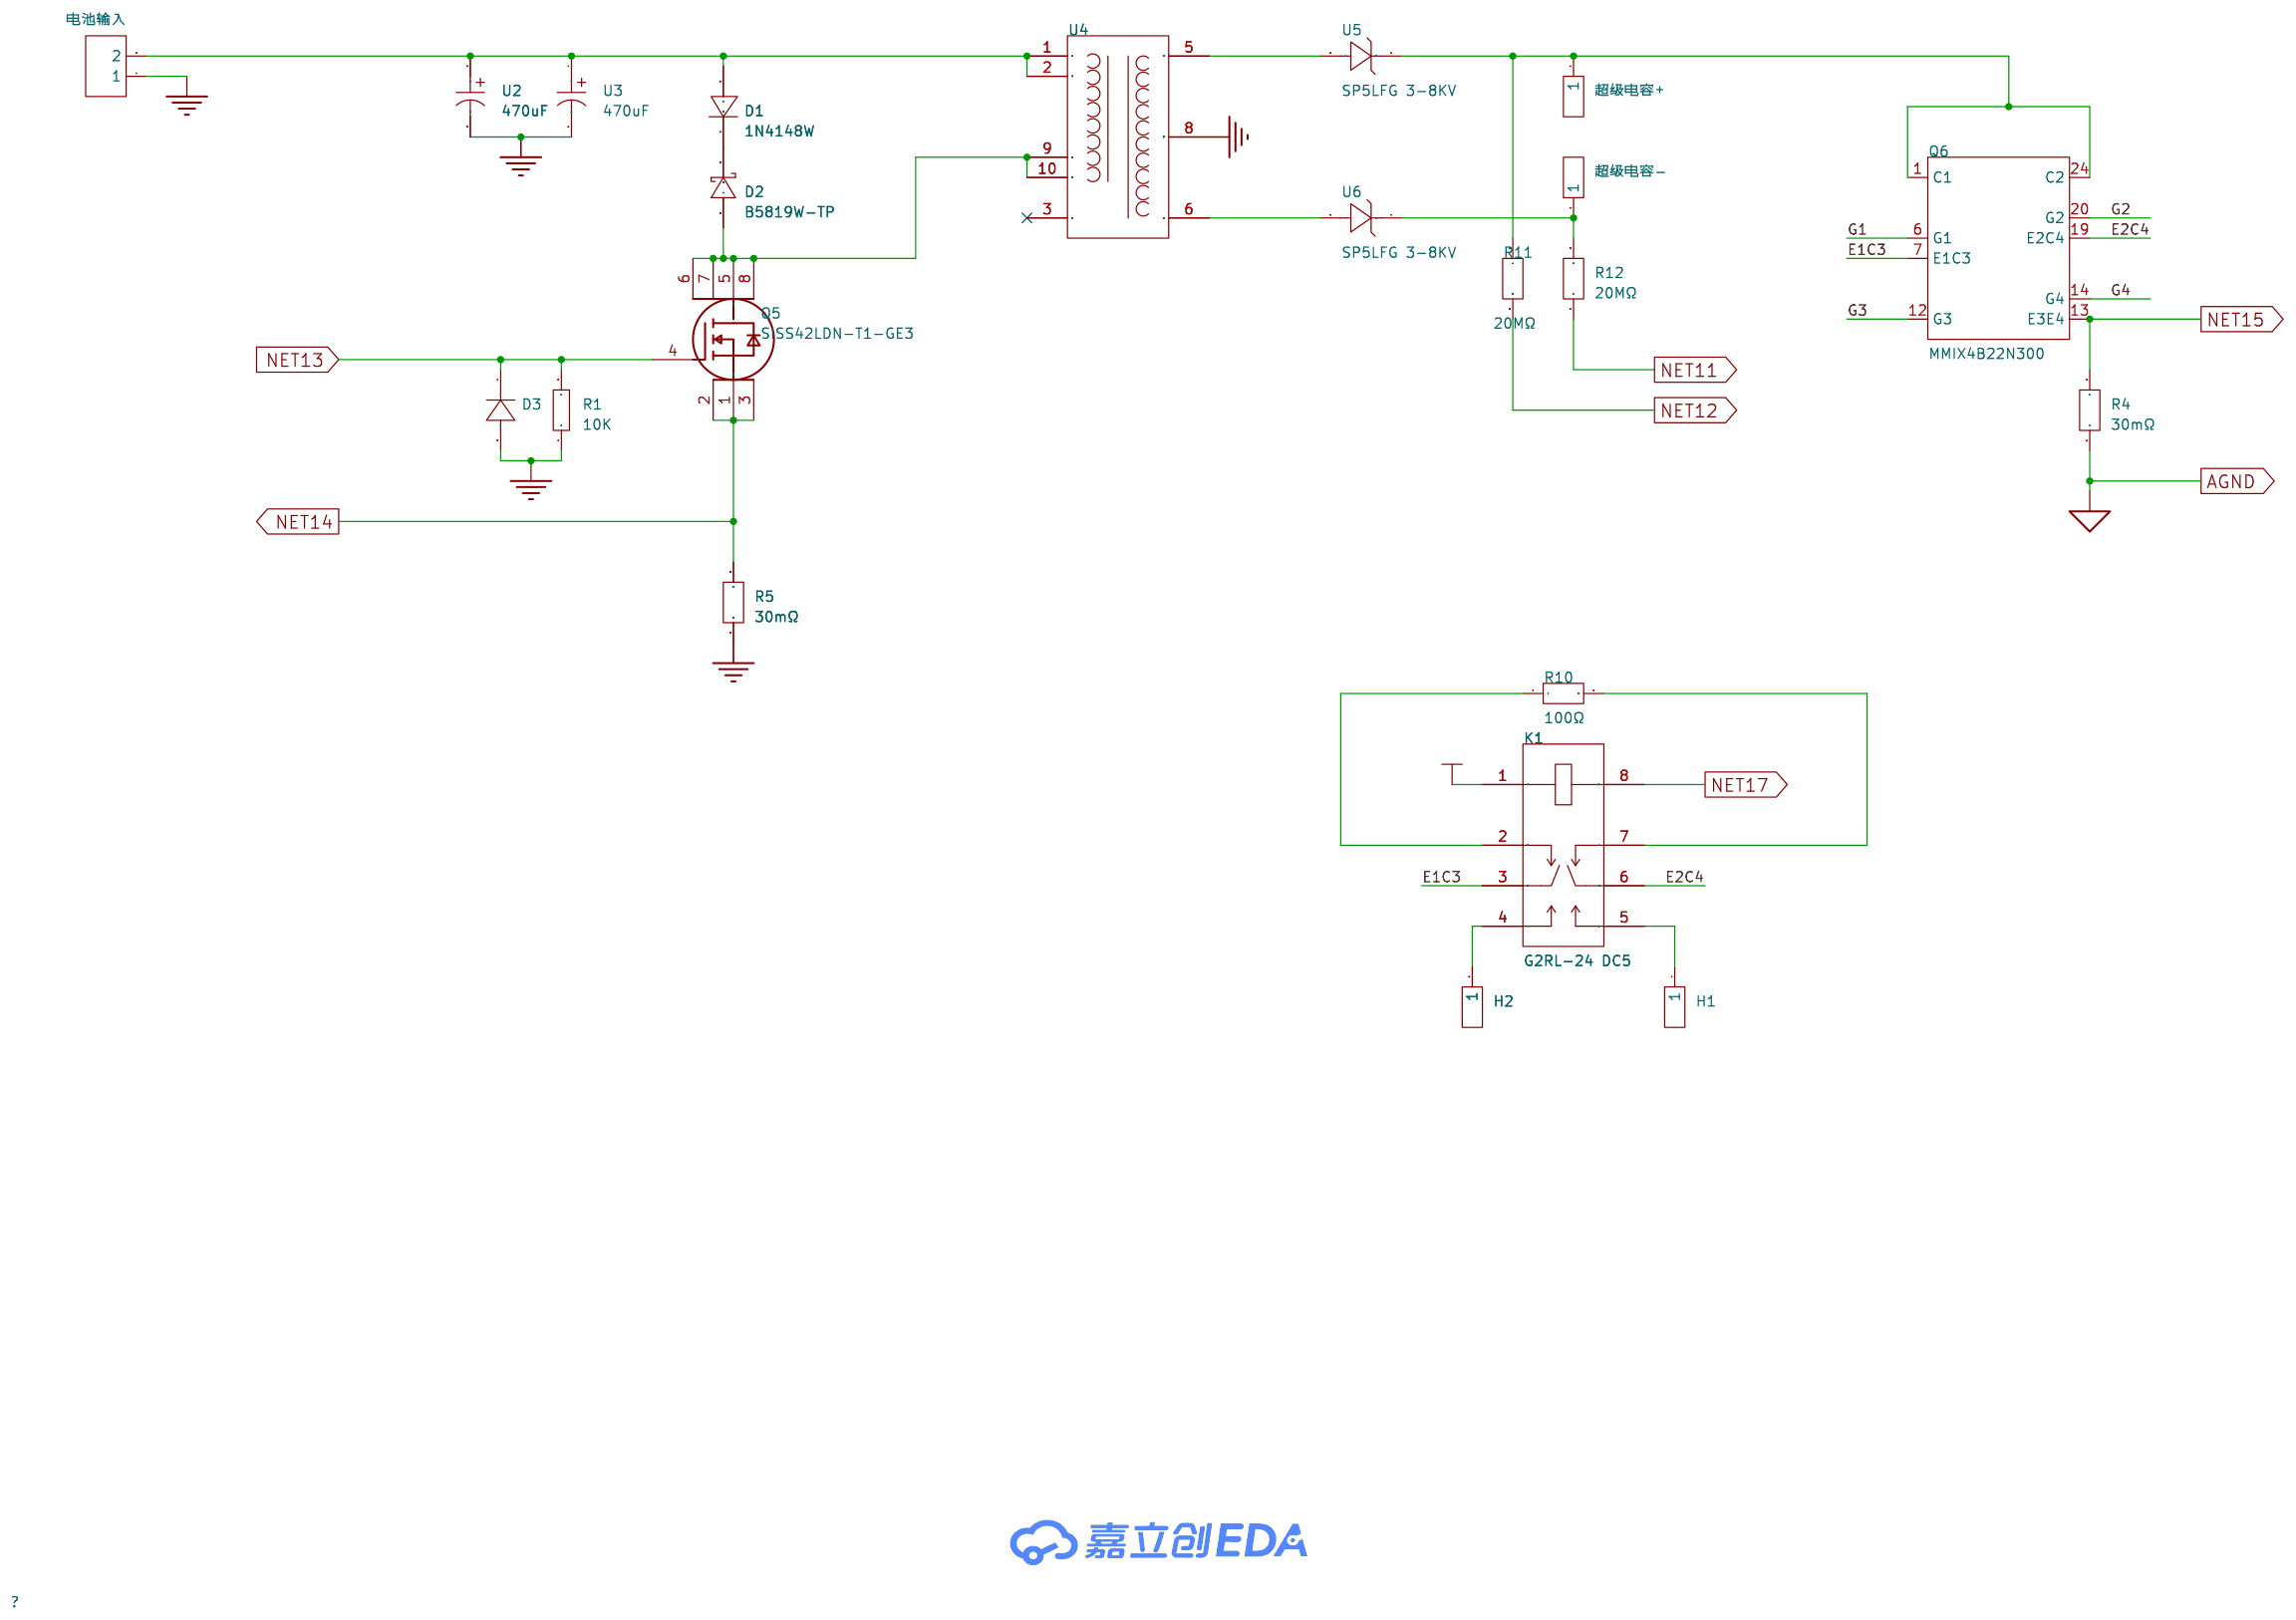
[diagram p1: schematic sheet]

## Parts
D1  1N4148W  [SOD-123_L2.8-W1.8-LS3.7-RD]
D2  B5819W-TP  [SOD-123_L2.8-W1.8-LS3.7-RD]
D3  -  [DO_1N4007]
H1  -  [HDR-TH_1P-V-M_XKB_X4611WV-01I-C28D40]
H2  -  [HDR-TH_1P-V-M_XKB_X4611WV-01I-C28D40]
K1  G2RL-24 DC5  [RELAY-TH_OMRON_G2RL-2X-X]
Q5  SISS42LDN-T1-GE3  [SOP-8L]
Q6  MMIX4B22N300  [SMD-9_L25.1-W23.1-P2.00-LS32.8-BR]
R1  10K  [R0603]
R4  30mΩ  [R2512]
R5  30mΩ  [R2512]
R10  100Ω  [R2512]
R11  20MΩ  [R0805]
R12  20MΩ  [R0805]
U2  470uF  [CAP-SMD_L7.3-W4.3-L-FD]
U3  470uF  [CAP-SMD_L7.3-W4.3-L-FD]
U4  -  [变压器SMD-8]
U5  SP5LFG 3-8KV  [SMA_L4.3-W2.6-LS5.1-RD]
U6  SP5LFG 3-8KV  [SMA_L4.3-W2.6-LS5.1-RD]
电池输入  -  [HDR-TH_2P-P2.54-V-F]
超级电容-  超级电容＋  [HDR-TH_1P-V-M_XKB_X4611WV-01I-C28D40]
超级电容＋  -  [HDR-TH_1P-V-M_XKB_X4611WV-01I-C28D40]

## Library data of the parts
D1 = 1N4148W_C444720: 二极管配置:-;正向压降(Vf):1V;直流反向耐压(Vr):75V;整流电流:150mA;反向恢复时间(Trr):4ns;; Supplier Part: C444720; Manufacturer: Slkor(萨科微); Supplier Footprint: SOD-123; JLCPCB Part Class: 扩展库; Datasheet: https://item.szlcsc.com/datasheet/1N4148W/446073.html; Supplier: LCSC; Voltage - Forward(Vf@If): 1V; Voltage - DC Reverse(Vr): 75V; Current - Rectified: 150mA; Pd - Power Dissipation: 410mW; Reverse Leakage Current (Ir): 5uA; Reverse Recovery Time (trr): 4ns; Operating Junction Temperature Range: -65℃~+150℃@(Tj); Non-Repetitive Peak Forward Surge Current: 2A
D2 = B5819W-TP: 二极管配置:-;正向压降(Vf):600mV@1A;直流反向耐压(Vr):40V;整流电流:1A;; LCSC Part Name: 电压:40V 电流:1A; Supplier Part: C84354; Manufacturer: MCC(美微科); Supplier Footprint: SOD-123; JLCPCB Part Class: 扩展库; Datasheet: https://item.szlcsc.com/datasheet/B5819W-TP/85524.html; Supplier: LCSC; Voltage - Forward(Vf@If): 600mV@1A; Voltage - DC Reverse(Vr): 40V; Current - Rectified: 1A; Reverse Leakage Current (Ir): 1mA@40V; Operating Junction Temperature Range: -65℃~+125℃; Non-Repetitive Peak Forward Surge Current: 10A
D3 = D_1N4007A: Supplier Footprint: DO-41
H1 H2 超级电容- 超级电容＋ = HDR-M_2.54_1x1P: Supplier Part: C81276; Supplier Footprint: 插件; JLCPCB Part Class: Extended Part
K1 = G2RL-24 DC5: 线圈电压:5V;触点形式:两组转换:2C(双刀双掷-转换);触点容量(电阻负载):12A@24VDC；12A@250VAC;最大切换电压:440V@AC；300V@DC;最大切换电流:8A;; LCSC Part Name: 5V 8A 两组转换:2C(双刀双掷-转换); Supplier Part: C6866153; Manufacturer: OMRON(欧姆龙); Supplier Footprint: 插件; JLCPCB Part Class: 扩展库; Datasheet: https://item.szlcsc.com/datasheet/G2RL-24%2520DC5/7829948.html; Supplier: LCSC; Coil Voltage: 5V; Contact Form: 两组转换:2C(双刀双掷-转换); Contact Rating: 12A@24VDC；12A@250VAC; Switching Voltage(Max): 440V@AC；300V@DC; Coil Rated Power: 400mW; Contact Material: 银合金(无镉); Switching Current(Max): 8A; Coil Resistance: 62.5Ω; Contact Resistance: 100mΩ; Operate Time: 15ms; Release Time: 5ms; Operating Temperature: -40℃~+85℃
Q5 = SISS42LDN-T1-GE3: Design Item ID: 8P-N; Library Name: *
Q6 = MMIX4B22N300: 集射极击穿电压(Vces):3kV;集电极电流(Ic):38A;功率(Pd):150W;; LCSC Part Name: 耐压:3kV 电流:38A; Supplier Part: C2936249; Manufacturer: Littelfuse/IXYS; Supplier Footprint: SMPD-24; JLCPCB Part Class: 扩展库; Datasheet: https://atta.szlcsc.com/upload/public/pdf/source/20240130/AED36A7DC3D00E586739519543A36A84.pdf; Supplier: LCSC; Collector-Emitter Breakdown Voltage (Vces): 3kV; Collector Current (Ic): 38A; Power Dissipation (Pd): 150W; Gate-Emitter Threshold Voltage (Vge(th)@Ic): 2.7V@15V,22A; Input Capacitance (Cies@Vce): 2.2nF@25V; Operating Temperature: -55℃~+150℃@(Tj)
R1 = Res_0603: Supplier Footprint: 0603
R4 R5 = JER2512F3R030: 电阻类型:采样电阻；合金电阻;阻值:30mΩ;精度:±1%;功率:3W;温度系数:±50ppm/℃;; LCSC Part Name: 30mΩ 3W 2512 ±1%; Supplier Part: C46634451; Manufacturer: JIERR(捷而瑞); Supplier Footprint: 2512; JLCPCB Part Class: 扩展库; Datasheet: https://item.szlcsc.com/datasheet/JER2512F3R030/48788253.html; Supplier: LCSC; Type: 采样电阻；合金电阻; Tolerance: ±1%; Power(Watts): 3W; Temperature Coefficient: ±50ppm/℃
R10 = FRP2512F1000TS: 电阻类型:厚膜电阻;阻值:100Ω;精度:±1%;功率:2W;工作电压:200V;温度系数:±200ppm/℃;; LCSC Part Name: 100Ω ±1% 2W 厚膜电阻; Supplier Part: C5126189; Manufacturer: FOJAN(富捷); Supplier Footprint: 2512; JLCPCB Part Class: 扩展库; Supplier: LCSC; Type: 厚膜电阻; Tolerance: ±1%; Power(Watts): 2W; Voltage-Supply(Max): 200V; Temperature Coefficient: ±200ppm/℃; Operating Temperature: -55℃~+155℃
R11 R12 = WF08G206JTL: 阻值:20MΩ;精度:±5%;; LCSC Part Name: 20MΩ ±5%; Supplier Part: C5122233; Manufacturer: Walsin(华新科); Supplier Footprint: 0805; JLCPCB Part Class: 扩展库; Datasheet: https://atta.szlcsc.com/upload/public/pdf/source/20190618/C384450_5928940070C175D9E9397917504D62F8.pdf; Supplier: LCSC; Tolerance: ±5%
U2 U3 = 6TPE470MW: 容值:470uF;精度:±20%;额定电压:6.3V;; LCSC Part Name: 470uF ±20% 6.3V; Supplier Part: C2972195; Manufacturer: PANASONIC(松下); JLCPCB Part Class: Extended Part; Datasheet: https://item.szlcsc.com/datasheet/6TPE470MW/3366328.html; Supplier: LCSC; Tolerance: ±20%; Voltage Rating: 6.3V; Operating Temperature: -55℃~+105℃
U4 = 变压器HR102315
U5 U6 = SMAJ6.0A_C19077525: 极性:单向;反向截止电压(Vrwm):6V;钳位电压:10.3V;峰值脉冲电流(Ipp):38.8A@10/1000us;峰值脉冲功率(Ppp):400W@10/1000us;击穿电压:7.37V;; LCSC Part Name: 单向TVS 6V截止 峰值浪涌电流：38.8A@10/1000us; Supplier Part: C19077525; Manufacturer: R+O(宏嘉诚); Supplier Footprint: DO-214AC(SMA); JLCPCB Part Class: 扩展库; Datasheet: https://item.szlcsc.com/datasheet/SMAJ6.0A/20275610.html; Supplier: LCSC; Polarity: 单向; Reverse Stand-Off Voltage (Vrwm): 6V; Clamping Voltage: 10.3V; Peak Pulse Current (Ipp): 38.8A@10/1000us; Peak Pulse Power Dissipation (Ppp): 400W@10/1000us; Voltage - Breakdown: 7.37V; Reverse Leakage Current (Ir): 800uA; Operating Temperature: -55℃~+150℃; level of protection: IEC 61000-4-2; Type: TVS
电池输入 = HDR-F_2.54_1x2P: Supplier Part: C49661; Supplier Footprint: 插件

## Nets
AGND: R4.1
GND: D3.2(A) R1.1 R5.1 U2.2 U3.2 U4.8 电池输入.1
VCC_5V_2: K1.1
E1C3: K1.3 Q6.7(E1C3)
E2C4: K1.6 Q6.19(E2C4)
G1: Q6.6(G1)
G2: Q6.20(G2)
G3: Q6.12(G3)
G4: Q6.14(G4)
NET11: R12.1
NET12: R11.2
NET13: D3.1(K) Q5.4(G) R1.2
NET14: Q5.1(S) Q5.2 Q5.3 R5.2
NET15: Q6.13(E3E4) R4.2
NET17: K1.8
Net-(D1-1): D1.1(C) D2.1(C)
Net-(D1-2): D1.2(A) U2.1 U3.1 U4.1 U4.2 电池输入.2
Net-(D2-2): D2.2(A) Q5.5(D) Q5.6 Q5.7 Q5.8 U4.9 U4.10
Net-(H1-1): H1.1 K1.5
Net-(H2-1): H2.1 K1.4
Net-(K1-2): K1.2 R10.1
Net-(K1-7): K1.7 R10.2
Net-(Q6-1): Q6.1(C1) Q6.24(C2) R11.1 U5.1(C) 超级电容＋.1
Net-(R12-2): R12.2 U6.1(C) 超级电容-.1
Net-(U4-5): U4.5 U5.2(A)
Net-(U4-6): U4.6 U6.2(A)

Not connected (* = marked no-connect by the designer): U4 3*

# Schematic 隔离
Board Name: Board3; Create Date: 2025-11-27; Page Name: P1; Project Name: AED; Schematic Name: 隔离; Update Date: 2025-11-27; Company: 嘉立创EDA; Page Size: A4; Version: V1.0
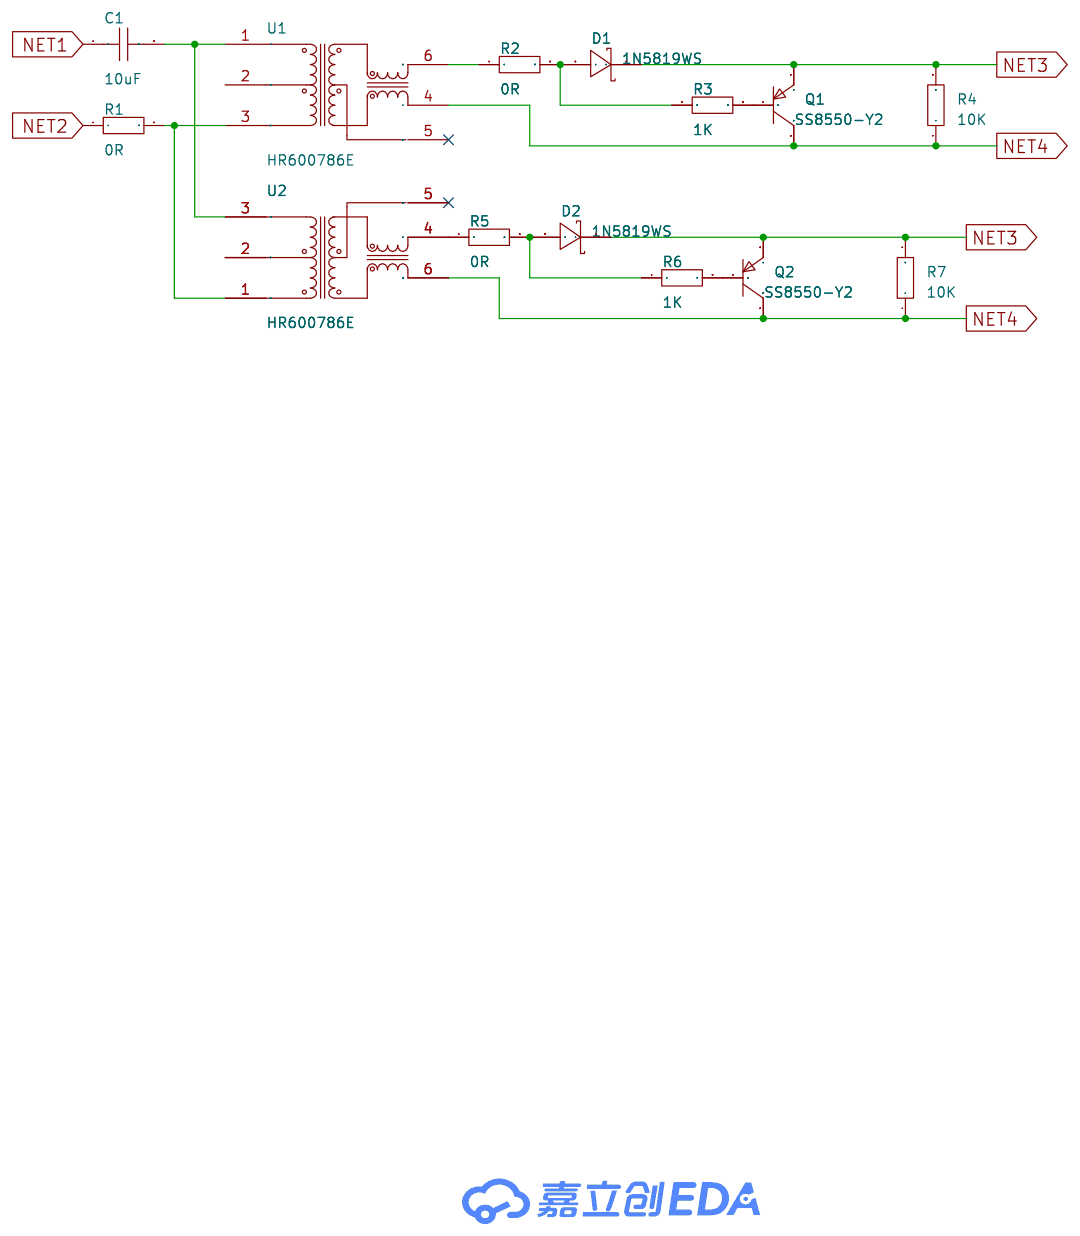
[diagram p2: schematic sheet]

## Parts
C1  10uF  [C0603]
D1  1N5819WS  [SOD-323_L1.8-W1.3-LS2.5-RD]
D2  1N5819WS  [SOD-323_L1.8-W1.3-LS2.5-RD]
Q1  SS8550-Y2  [SOT-23-3_L2.9-W1.3-P0.95-LS2.4-BR]
Q2  SS8550-Y2  [SOT-23-3_L2.9-W1.3-P0.95-LS2.4-BR]
R1  0R  [R0603]
R2  0R  [R0603]
R3  1K  [R0603]
R4  10K  [R0603]
R5  0R  [R0603]
R6  1K  [R0603]
R7  10K  [R0603]
U1  HR600786E  [XFMR-SMD_HR600786E]
U2  HR600786E  [XFMR-SMD_HR600786E]

## Library data of the parts
C1 = CAP_0603: Supplier Footprint: 0603
D1 D2 = 1N5819WS_C191023: 正向压降(Vf):600mV@1A;直流反向耐压(Vr):40V;整流电流:1A;; LCSC Part Name: 电压:40V 电流:1A; Supplier Part: C191023; Manufacturer: Hottech(合科泰); Supplier Footprint: SOD-323; JLCPCB Part Class: 基础库; Datasheet: https://item.szlcsc.com/datasheet/1N5819WS/213850.html; Supplier: LCSC; Voltage - Forward(Vf@If): 600mV@1A; Voltage - DC Reverse(Vr): 40V; Current - Rectified: 1A; Non-Repetitive Peak Forward Surge Current: 25A
Q1 Q2 = SS8550-Y2_C364314: 晶体管类型:PNP;集电极电流(Ic):1.5A;集射极击穿电压(Vceo):25V;耗散功率(Pd):200mW;直流电流增益(hFE):120@100mA,1V;; LCSC Part Name: H档200-350; Supplier Part: C364314; Manufacturer: MDD(辰达半导体); Supplier Footprint: SOT-23; JLCPCB Part Class: 扩展库; Datasheet: https://atta.szlcsc.com/upload/public/pdf/source/20241121/DD4CB7CDFBCE684CC57C9FEFD52A695F.pdf; Supplier: LCSC; type: PNP; Current - Collector(Ic): 1.5A; Collector - Emitter Voltage VCEO: 25V; Pd - Power Dissipation: 200mW; DC Current Gain: 120@100mA,1V; Transition frequency(fT): 100MHz; Current - Collector Cutoff: 100nA; Vce Saturation(VCE(sat)): 500mV; Operating Temperature: -55℃~+150℃
R1-R7 = Res_0603: Supplier Footprint: 0603
U1 U2 = HR600786E: Supplier Part: C19724767; Manufacturer: HANRUN(汉仁); Supplier Footprint: SMD-6P,9.9x8.1mm; JLCPCB Part Class: 扩展库; Datasheet: https://item.szlcsc.com/datasheet/HR600786E/21045358.html; Supplier: LCSC

## Nets
NET1: C1.1
NET2: R1.1
NET3: D1.1(K) D2.1(K) Q1.2(E) Q2.2(E) R4.2 R7.2
NET4: Q1.3(C) Q2.3(C) R4.1 R7.1 U1.4 U2.6
Net-(C1-2): C1.2 U1.1 U2.3
Net-(D1-2): D1.2(A) R2.2 R3.1
Net-(D2-2): D2.2(A) R5.2 R6.1
Net-(Q1-1): Q1.1(B) R3.2
Net-(Q2-1): Q2.1(B) R6.2
Net-(R1-2): R1.2 U1.3 U2.1
Net-(R2-1): R2.1 U1.6
Net-(R5-1): R5.1 U2.4

Not connected (* = marked no-connect by the designer): U1 2 5*; U2 2 5*
